# Altium schematic sheet Main System.SchDoc
size A4; SheetNumber: 1; SheetTotal: 4
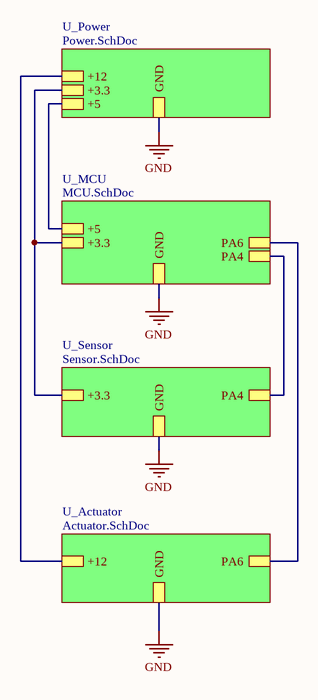
[diagram p0: Main System.SchDoc]

## Sub-sheets
U_Actuator = Actuator.SchDoc: PA6, +12, GND
U_MCU = MCU.SchDoc: +3.3, GND, +5, PA4, PA6
U_Power = Power.SchDoc: +3.3, GND, +5, +12
U_Sensor = Sensor.SchDoc: +3.3, PA4, GND

## Nets
GND: sheet U_Power/GND, sheet U_MCU/GND, sheet U_Sensor/GND, sheet U_Actuator/GND
(unnamed): sheet U_Power/+3.3, sheet U_MCU/+3.3, sheet U_Sensor/+3.3
(unnamed): sheet U_Power/+5, sheet U_MCU/+5
(unnamed): sheet U_Power/+12, sheet U_Actuator/+12
(unnamed): sheet U_MCU/PA4, sheet U_Sensor/PA4
(unnamed): sheet U_MCU/PA6, sheet U_Actuator/PA6